# Altium schematic sheet TB GPIO Trans.SchDoc
size A4; SheetNumber: 1; SheetTotal: 1
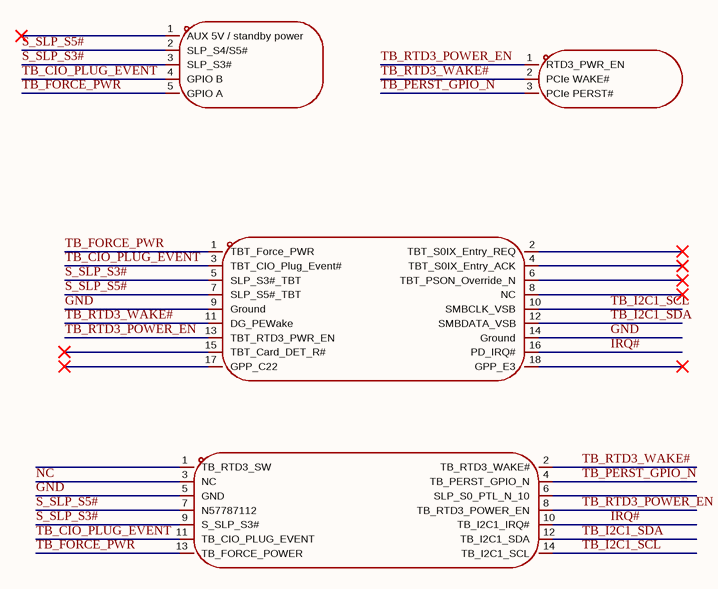
[diagram p0: TB GPIO Trans.SchDoc]

## Parts
CN01  hx-ph2.0-5pzz  [CONN-TH_HX-PH2.0-5PZZ]  (value not drawn)
CN02  hx-ph2.0-3pzz-b  [CONN-TH_HX-PH2.0-3PZZ-B]  (value not drawn)
U01  pm200-2-07-s-4.3-ASUS-Plug  [HDR-TH_14P-P2.00-V-F-R2-C7-S2.00-3]  (value not drawn)
U??  pm200-2-09-z-4.3_MSI_Socket  [HDR-TH_18P-P2.00-V-F-R2-C9-S2.00-1-socket]  (value not drawn)

## Nets
GND: U01.5(GND) U??.9(Ground) U??.14(Ground)
IRQ#: U01.10(TB_I2C1_IRQ#) U??.16(PD_IRQ#)
NC: U01.3(NC)
S_SLP_S3#: CN01.3(SLP_S3#) U01.9(S_SLP_S3#) U??.5(SLP_S3#_TBT)
S_SLP_S5#: CN01.2(SLP_S4/S5#) U01.7(N57787112) U??.7(SLP_S5#_TBT)
TB_CIO_PLUG_EVENT: CN01.4(GPIO_B) U01.11(TB_CIO_PLUG_EVENT) U??.3(TBT_CIO_Plug_Event#)
TB_FORCE_PWR: CN01.5(GPIO_A) U01.13(TB_FORCE_POWER) U??.1(TBT_Force_PWR)
TB_I2C1_SCL: U01.14(TB_I2C1_SCL) U??.10(SMBCLK_VSB)
TB_I2C1_SDA: U01.12(TB_I2C1_SDA) U??.12(SMBDATA_VSB)
TB_PERST_GPIO_N: CN02.3(PCIe_PERST#) U01.4(TB_PERST_GPIO_N)
TB_RTD3_POWER_EN: CN02.1(RTD3_PWR_EN) U01.8(TB_RTD3_POWER_EN) U??.13(TBT_RTD3_PWR_EN)
TB_RTD3_WAKE#: CN02.2(PCIe_WAKE#) U01.2(TB_RTD3_WAKE#) U??.11(DG_PEWake)

Not connected (* = marked no-connect by the designer): CN01 1(AUX_5V_/_standby_power)*; U01 1(TB_RTD3_SW) 6(SLP_S0_PTL_N_10); U?? 2(TBT_S0IX_Entry_REQ)* 4(TBT_S0IX_Entry_ACK)* 6(TBT_PSON_Override_N)* 8(NC)* 15(TBT_Card_DET_R#)* 17(GPP_C22)* 18(GPP_E3)*

## Library data of the parts
CN01 = hx-ph2.0-5pzz: 插针结构:1x5P;间距:2mm;安装方式:直插;参考系列:PH;总PIN数:5P;排数:1;每排PIN数:5;行距:-;额定电流:2A;触头材质:黄铜;触头镀层:锡;工作温度:-25℃~+85℃;; Manufacturer: hanxia(韩下); AddInBom: yes; Pins Structure: 1x5P; Pitch: 2mm; Reference Series: PH; Number of PINs Per Row: 5; Current Rating: 2A; Voltage Rating: 250V; Plastic Material: PA66; Flame Retardant Rating: UL94V-0; Symbol: HX-PH2.0-5PZZ; LCSC Part Name: 1x5P 间距:2mm 直插 系列:PH; SupplierPart: C48641620; ManufacturerPart: HX-PH2.0-5PZZ; Supplier Footprint: 插件,P=2mm; JLCPCB Part Class: Extended Part; Datasheet: https://item.szlcsc.com/datasheet/HX-PH2.0-5PZZ/50919866.html; Supplier: LCSC; ConvertToPcb: yes; FootprintName: CONN-TH_HX-PH2.0-5PZZ; Mounting Type: 直插; Number of Pins: 5P; Number of Rows: 1; Row Spacing: -; Contact Material: 黄铜; Contact Plating: 锡; Operating Temperature: -25℃~+85℃; Color: 白色
CN02 = hx-ph2.0-3pzz-b: 插针结构:1x3P;间距:2mm;安装方式:直插;参考系列:PH;总PIN数:3P;排数:1;每排PIN数:3;行距:-;额定电流:2A;触头材质:黄铜;触头镀层:锡;工作温度:-25℃~+85℃;; Manufacturer: hanxia(韩下); AddInBom: yes; Pins Structure: 1x3P; Pitch: 2mm; Reference Series: PH; Number of PINs Per Row: 3; Current Rating: 2A; Voltage Rating: 250V; Plastic Material: PA66; Flame Retardant Rating: UL94V-0; Symbol: HX-PH2.0-3PZZ-B; LCSC Part Name: 1x3P 间距:2mm 直插 系列:PH; SupplierPart: C49009993; ManufacturerPart: HX-PH2.0-3PZZ-B; Supplier Footprint: 插件,P=2mm; JLCPCB Part Class: Extended Part; Datasheet: https://item.szlcsc.com/datasheet/HX-PH2.0-3PZZ-B/51365914.html; Supplier: LCSC; ConvertToPcb: yes; FootprintName: CONN-TH_HX-PH2.0-3PZZ-B; Mounting Type: 直插; Number of Pins: 3P; Number of Rows: 1; Row Spacing: -; Contact Material: 黄铜; Contact Plating: 锡; Operating Temperature: -25℃~+85℃; Supplementary Features: -; Color: 黑色; Z-Height of the Board: -; X-Length of Bottom Edge on Board (Spacing Line): -; Y-Width of Bottom Edge on Board: -
U01 = pm200-2-07-ASUS-TB-PLUG: 插孔结构:2x7P;间距:2mm;行距:2mm;圆孔/方孔:方孔;安装方式:立贴;排数:双排;总孔位数:14P;额定电流:1.5A;插孔方向:顶部;塑高:4.3mm;触头材质:黄铜;工作温度:-40℃~+105℃;; Manufacturer: HCTL(华灿天禄); AddInBom: yes; Holes Structure: 2x7P; Pitch: 2mm; Circular Hole / Square Hole: 方孔; Number of Positions: 14P; Current Rating: 1.5A; Holes Direction: 顶部; Symbol: PM200-2-07-S-4.3; LCSC Part Name: 2x7P 间距:2mm 立贴; SupplierPart: C3975171; ManufacturerPart: PM200-2-07-S-4.3; Supplier Footprint: SMD,P=2mm; JLCPCB Part Class: Extended Part; Datasheet: https://item.szlcsc.com/datasheet/PM200-2-07-S-4.3/4543722.html; Supplier: LCSC; ConvertToPcb: yes; FootprintName: HDR-SMD_14P-P2.00-V-F-R2-C7-LS6.5-A; Row Spacing: 2mm; Mounting Type: 立贴; Number of Rows: 双排; Insulation Height: 4.3mm; Contact Material: 黄铜; Operating Temperature: -40℃~+105℃
U?? = pm200-2-09-z-4.3_Socket: 插孔结构:2x9P;间距:2mm;行距:2mm;圆孔/方孔:方孔;安装方式:直插;排数:双排;总孔位数:18P;额定电流:1.5A;插孔方向:顶部;塑高:4.3mm;触头材质:黄铜;工作温度:-40℃~+105℃;; Manufacturer: HCTL(华灿天禄); Symbol: PM200-2-09-Z-4.3_C3012173; AddInBom: yes; ModelId: 27f2729bd6294aaf8e872fe91d00ea97; ModelName: HDR-TH_18P-P2.00-V-F-R2-C9-S2.00-1; ModelTransform: 732.282,177.165,0,0,0,0,0,0,-118.11; Holes Structure: 2x9P; Pitch: 2mm; Circular Hole / Square Hole: 方孔; Number of Positions: 18P; Current Rating: 1.5A; Holes Direction: 顶部; LCSC Part Name: 2x9P 间距:2mm 直插; SupplierPart: C3012173; ManufacturerPart: PM200-2-09-Z-4.3; Supplier Footprint: 插件,P=2mm; JLCPCB Part Class: Extended Part; Datasheet: https://item.szlcsc.com/datasheet/PM200-2-09-Z-4.3/3516644.html; Supplier: LCSC; ConvertToPcb: yes; FootprintName: HDR-TH_18P-P2.00-V-F-R2-C9-S2.00-1; Row Spacing: 2mm; Mounting Type: 直插; Number of Rows: 双排; Insulation Height: 4.3mm; Contact Material: 黄铜; Operating Temperature: -40℃~+105℃